# Altium project Rackmonitor.PrjPcb (part 1 of 2)
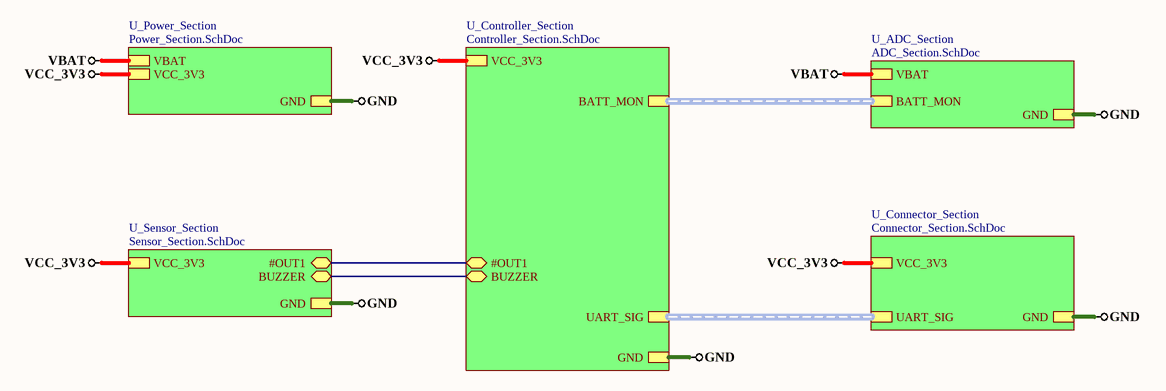
[diagram p0: Top_Section.SchDoc]
6 sheets, 59 parts. Net scope: strictly hierarchical (ports join the sheet entries above them; power ports are local).
Board file: Shock_Sensor.PcbDoc
Sheets:
  Top_Section.SchDoc
    U_Sensor_Section = Sensor_Section.SchDoc
    U_ADC_Section = ADC_Section.SchDoc
    U_Power_Section = Power_Section.SchDoc
    U_Controller_Section = Controller_Section.SchDoc
    U_Connector_Section = Connector_Section.SchDoc

## Sheet Top_Section.SchDoc
size A; DocumentNumber: 6; SheetNumber: 1; SheetTotal: 6

### Sub-sheets
U_ADC_Section = ADC_Section.SchDoc: GND, VBAT, BATT_MON (harness BATT_MON)
U_Connector_Section = Connector_Section.SchDoc: GND, UART_SIG (harness UART_SIG), VCC_3V3
U_Controller_Section = Controller_Section.SchDoc: GND, VCC_3V3, #OUT1 (bidir), BATT_MON (harness BATT_MON), UART_SIG (harness UART_SIG), BUZZER (bidir)
U_Power_Section = Power_Section.SchDoc: GND, VBAT, VCC_3V3
U_Sensor_Section = Sensor_Section.SchDoc: GND, VCC_3V3, #OUT1 (bidir), BUZZER (bidir)

### Nets
GND: sheet U_Sensor_Section/GND, sheet U_ADC_Section/GND, sheet U_Power_Section/GND, sheet U_Controller_Section/GND, sheet U_Connector_Section/GND
VBAT: sheet U_ADC_Section/VBAT, sheet U_Power_Section/VBAT
VCC_3V3: sheet U_Sensor_Section/VCC_3V3, sheet U_Power_Section/VCC_3V3, sheet U_Controller_Section/VCC_3V3, sheet U_Connector_Section/VCC_3V3
#OUT1: sheet U_Sensor_Section/#OUT1, sheet U_Controller_Section/#OUT1
BUZZER: sheet U_Sensor_Section/BUZZER, sheet U_Controller_Section/BUZZER

### Buses and harness runs
harness sheet U_ADC_Section/BATT_MON = sheet U_Controller_Section/BATT_MON
harness sheet U_Connector_Section/UART_SIG = sheet U_Controller_Section/UART_SIG

## Sheet Sensor_Section.SchDoc
size A; DocumentNumber: 3; SheetNumber: 4; SheetTotal: 6
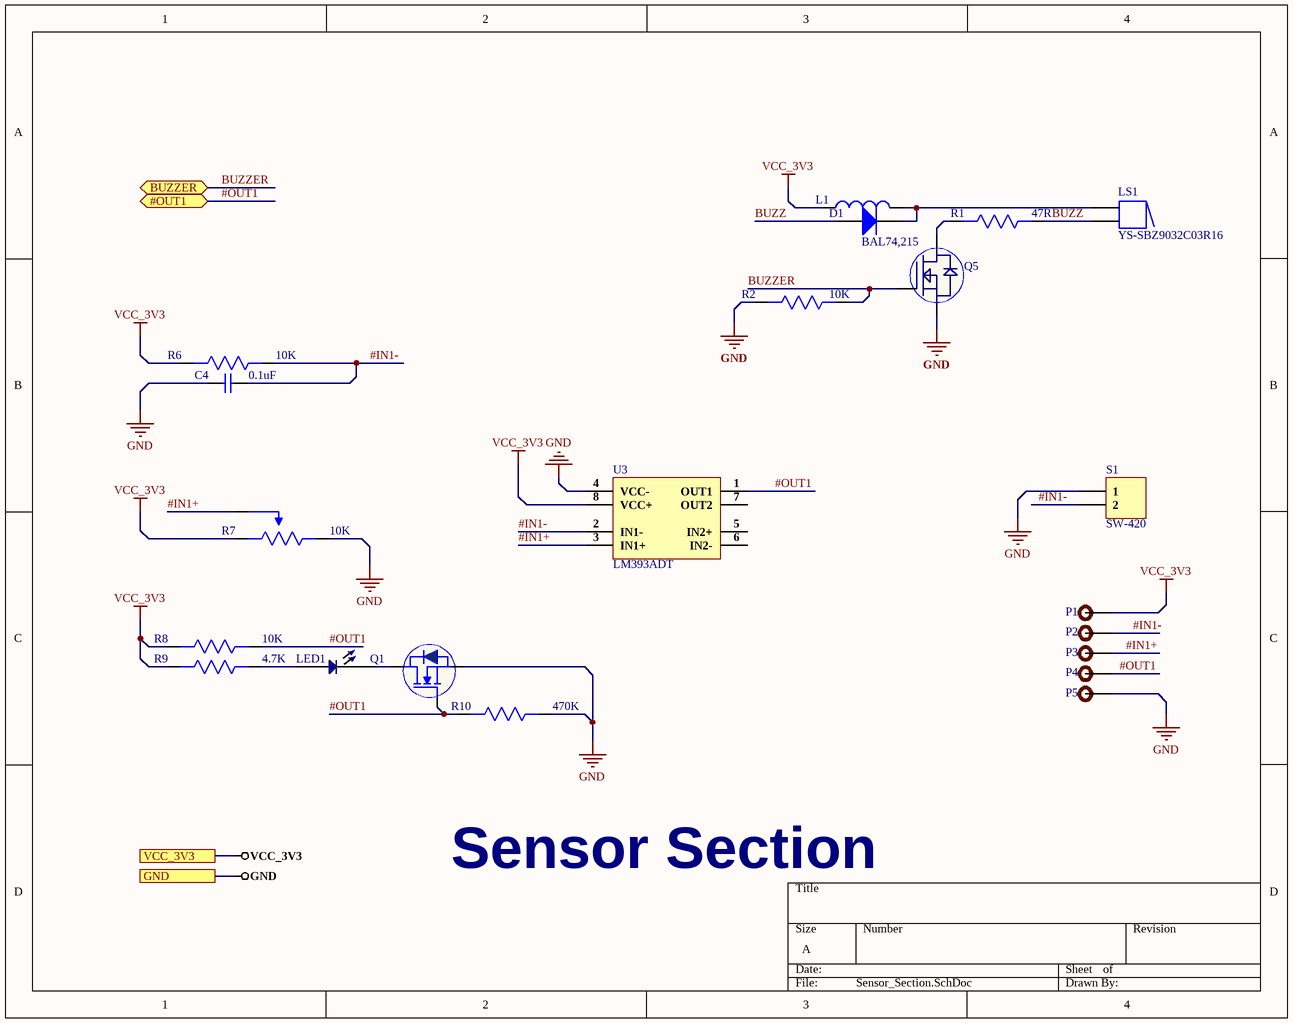
[diagram p1: Sensor_Section.SchDoc]

### Parts
C4  0.1uF  [CAP-0603]
D1  BAL74,215  [sot-23]
L1  MMZ0603S601CT000  [IND 0201]  (value not drawn)
LED1  XZVG68W-2  [LED 0402]  (value not drawn)
LS1  YS-SBZ9032C03R16  [YS-SBZ9032C03R16]
P1  TEST POINT  [TEST POINT]  (value not drawn)
P2  TEST POINT  [TEST POINT]  (value not drawn)
P3  TEST POINT  [TEST POINT]  (value not drawn)
P4  TEST POINT  [TEST POINT]  (value not drawn)
P5  TEST POINT  [TEST POINT]  (value not drawn)
Q1  2N7002T-7-F  [SOT-523]  (value not drawn)
Q5  BSS138LT1G  [sot-23]  (value not drawn)
R1  47R  [RES-0603]
R2  10K  [RES-0603]
R6  10K  [RES-0603]
R7  10K  [TC33X-2-103E]
R8  10K  [RES-0603]
R9  4.7K  [RES-0603]
R10  470K  [RES-0603]
S1  SW-420  [SW-420]
U3  LM393ADT  [8-SOIC]

### Ports
#OUT1 (bidir), BUZZER (bidir), GND, VCC_3V3

### Nets
GND: C4.1 P5.1 Q1.2(S) Q5.2(S) R2.2 R7.3(CW) R10.1 S1.1 U3.4(VCC-) ; port GND
VCC_3V3: L1.1 P1.1 R6.2 R7.1(CCW) R8.2 R9.2 U3.8(VCC+) ; port VCC_3V3
#IN1+: P3.1 R7.2(Wiper) U3.3(IN1+)
#IN1-: C4.2 P2.1 R6.1 S1.2 U3.2(IN1-)
#OUT1: P4.1 Q1.1(G) R8.1 R10.2 U3.1(OUT1) ; port #OUT1
BUZZ: D1.2(A) LS1.2 R1.1
BUZZER: Q5.1(G) R2.1 ; port BUZZER
NetD1_1: D1.1(K) L1.2 LS1.1
NetLED1_1: LED1.1 R9.1
NetLED1_2: LED1.2 Q1.3(G)
NetQ5_3: Q5.3(D) R1.2

Not connected (* = marked no-connect by the designer): U3 5(IN2+) 6(IN2-) 7(OUT2)

### Notes on the sheet
- Sensor Section

### Library data of the parts
C4 = CL10B104KB8NNNL: CL10 Series 0603 0.1 uF 50 V ±10% Tolerance X7R Multilayer Ceramic Capacitor; Manufacturer: Samsung; Capacitance: 100nF; Voltage Rating: 50V; Supplier 1: Digi-Key; Manufacturer Part Number: CL10B104KB8NNNL; RoHS: Yes; Category: Ceramic Capacitors; Pricing 1: 1=0.10000, 10=0.03100, 50=0.01660, 100=0.01360, 500=0.00974, 1000=0.00765, 2500=0.00696, 5000=0.00640 (USD); Mount: Surface Mount; Case/Package: 0603; Min Operating Temperature: -55°C; Max Operating Temperature: 125°C; Tolerance: 10%; Dielectric: X7R; Packaging: Tape and Reel; Package Quantity: 15000; Voltage Rating (DC): 50V; Series: CL; Construction: Flat; Length: 1.6mm; Width: 0.031inch; Height: 0.8mm; Thickness: 0.035inch; Depth: 0.8mm; Radiation Hardening: No; RoHS Compliant: Yes; ComponentLink1URL: https://datasheet.ciiva.com/26838/getdatasheetpartid-357523-26838415.pdf?src-supplier=Verical; ComponentLink1Description: https://datasheet.ciiva.com/26838/getdatasheetpartid-357523-26838415.pdf?src-supplier=Verical; ComponentLink2URL: https://datasheet.ciiva.com/25741/cl10b104kb8nnnl-25741341.pdf?src-supplier=Digi-Key; ComponentLink2Description: https://datasheet.ciiva.com/25741/cl10b104kb8nnnl-25741341.pdf?src-supplier=Digi-Key; Supplier Part Number 1: 1276-CL10B104KB8NNNLDKR-ND
D1 = BAL74,215: DIODE GEN PURP 50V 215MA SOT23; Manufacturer: NXP Semiconductors; Manufacturer Part Number: BAL74215; Element Configuration: Single; Forward Current: 150mA; Max Reverse Current: 100nA; Reverse Recovery Time: 4ns; Peak Non-Repetitive Surge Current: 4A; Forward Voltage: 1.25V; Supplier 1: Newark; RoHS: Yes; Category: Rectifier Diodes; Mount: Surface Mount; Case/Package: TO-236-3; Number of Pins: 3; Contact Plating: Tin; Min Operating Temperature: -65°C; Max Operating Temperature: 150°C; Max Repetitive Reverse Voltage (Vrrm): 50V; Packaging: Tape and Reel; Max Surge Current: 4A; Recovery Time: 4ns; Package Quantity: 1; Max Reverse Leakage Current: 100nA; Average Rectified Current: 215mA; Max Forward Surge Current (Ifsm): 4A; Termination: SMD/SMT; Max Reverse Voltage (DC): 50V; Radiation Hardening: No; REACH SVHC: No SVHC; Lead Free: Lead Free; ComponentLink1URL: https://datasheet.ciiva.com/8299/bal74-8299264.pdf?src-supplier=Avnet; ComponentLink1Description: https://datasheet.ciiva.com/8299/bal74-8299264.pdf?src-supplier=Avnet; ComponentLink2URL: https://datasheet.ciiva.com/1179/453930-1179601.pdf?src-supplier=Element14; ComponentLink2Description: https://datasheet.ciiva.com/1179/453930-1179601.pdf?src-supplier=Element14; ComponentLink3URL: https://datasheet.ciiva.com/4434/bal74-109975-4434835.pdf?src-supplier=Mouser; ComponentLink3Description: https://datasheet.ciiva.com/4434/bal74-109975-4434835.pdf?src-supplier=Mouser; ComponentLink4URL: https://datasheet.ciiva.com/25953/bal74-25953738.pdf?src-supplier=Avnet+Europe; ComponentLink4Description: https://datasheet.ciiva.com/25953/bal74-25953738.pdf?src-supplier=Avnet+Europe; ComponentLink5URL: https://datasheet.ciiva.com/912/bal74-912156.pdf?src-supplier=Digi-Key; ComponentLink5Description: https://datasheet.ciiva.com/912/bal74-912156.pdf?src-supplier=Digi-Key; ComponentLink6URL: https://datasheet.ciiva.com/1202/453930-1202220.pdf?src-supplier=Farnell; ComponentLink6Description: https://datasheet.ciiva.com/1202/453930-1202220.pdf?src-supplier=Farnell; ComponentLink7URL: https://datasheet.ciiva.com/912/bal74-912157.pdf?src-supplier=Digi-Key; ComponentLink7Description: https://datasheet.ciiva.com/912/bal74-912157.pdf?src-supplier=Digi-Key; ComponentLink8URL: https://datasheet.ciiva.com/1202/453930-1202221.pdf?src-supplier=Farnell; ComponentLink8Description: https://datasheet.ciiva.com/1202/453930-1202221.pdf?src-supplier=Farnell; ComponentLink9URL: https://datasheet.ciiva.com/912/bal74-912158.pdf?src-supplier=Digi-Key; ComponentLink9Description: https://datasheet.ciiva.com/912/bal74-912158.pdf?src-supplier=Digi-Key; Supplier Part Number 1: 75R4923
L1 = MMZ0603S601CT000: FERRITE BEAD 600 OHM 0201 1LN; Manufacturer: TDK; Impedance: 600R; Tolerance: 25%; DC Resistance (DCR): 1.45R; Max DC Current: 100mA; Supplier 1: Digi-Key; Manufacturer Part Number: MMZ0603S601CT000; RoHS: Yes; Category: Inductors; Stock 1: 1540; Pricing 1: 1=0.12000, 10=0.09900, 25=0.07680, 50=0.06380, 100=0.05500, 250=0.04400, 500=0.03960, 1000=0.03300, 5000=0.03080 (USD); Mount: Surface Mount; Case/Package: 0201; Core Material: Ferrite; Case Code (Metric): 0603; Case Code (Imperial): 0201; Packaging: Cut Tape; Package Quantity: 15000; Current Rating: 100mA; Length: 0.024inch; Width: 0.012inch; Height: 0.013inch; REACH SVHC: No SVHC; Lead Free: Lead Free; RoHS Compliant: Yes; ComponentLink1URL: https://datasheet.ciiva.com/46381/1795294-46381669.pdf?src-supplier=Element14; ComponentLink1Description: https://datasheet.ciiva.com/46381/1795294-46381669.pdf?src-supplier=Element14; ComponentLink2URL: https://datasheet.ciiva.com/46634/beads-commercial-signal-mmz-en-46634390.pdf?src-supplier=Digi-Key; ComponentLink2Description: https://datasheet.ciiva.com/46634/beads-commercial-signal-mmz-en-46634390.pdf?src-supplier=Digi-Key; ComponentLink3URL: https://datasheet.ciiva.com/48682/beads-commercial-signal-mmz-en-48682603.pdf?src-supplier=Avnet; ComponentLink3Description: https://datasheet.ciiva.com/48682/beads-commercial-signal-mmz-en-48682603.pdf?src-supplier=Avnet; ComponentLink4URL: https://datasheet.ciiva.com/46634/beads-commercial-signal-mmz-en-46634381.pdf?src-supplier=Digi-Key; ComponentLink4Description: https://datasheet.ciiva.com/46634/beads-commercial-signal-mmz-en-46634381.pdf?src-supplier=Digi-Key; Supplier Part Number 1: 445-2146-1-ND
LED1 = XZVG68W-2: LED GREEN CLEAR CHIP SMD; Manufacturer: SunLED; Lens Color: Colorless; Luminous Intensity: 49mcd; Test Current: 20mA; Viewing Angle: 120°; Dominant Wavelength: 570nm; Forward Voltage: 2.1V; Supplier 1: Digi-Key; Manufacturer Part Number: XZVG68W-2; RoHS: Yes; Category: LEDs; Stock 1: 596167; Pricing 1: 1=0.37000, 10=0.29300, 100=0.13140, 500=0.11872, 1000=0.09752 (USD); Mount: Surface Mount; Case/Package: 0402; Color: Green; Case Code (Metric): 1005; Case Code (Imperial): 0402; Packaging: Tape and Reel; Lens Transparency: Clear; Length: 1mm; Width: 0.5mm; Height: 0.6mm; RoHS Compliant: Yes; ComponentLink1URL: http://www.sunledusa.com/products/spec/XZVG68W-2.pdf?src-supplier=Digi-Key; ComponentLink1Description: http://www.sunledusa.com/products/spec/XZVG68W-2.pdf?src-supplier=Digi-Key; ComponentLink2URL: https://www.sunledusa.com/products/spec/XZVG68W-2.pdf?src-supplier=Digi-Key; ComponentLink2Description: https://www.sunledusa.com/products/spec/XZVG68W-2.pdf?src-supplier=Digi-Key; Supplier Part Number 1: 1497-1219-1-ND
LS1 = YS-SBZ9032C03R16: NO 2700Hz 85dB @ 3V, 10cm 3V Φ9mm SMD,9x3.2mm Buzzers RoHS; Manufacturer: Fengming; Operating Voltage: 2 ~ 4V; Package: SMD,9x3.2mm; Frequency - Self Resonant: 2700Hz; Rated Voltage: 3V
P1-P5 = TEST POINT: Test Point ON
Q1 = 2N7002T-7-F: MOSFET N-Channel 60V 0.115A SOT523; Manufacturer: Diodes; Number of Terminals/Pins: 3; Package Body Material: Plastic; Transistor Element Material: SILICON; Continuous Drain Current (ID): 115mA; Gate to Source Voltage (Vgs): 20V; Turn-Off Delay Time: 11ns; Turn-On Delay Time: 7ns; Rds On Max: 7.5R; Input Capacitance: 50pF; Nominal Vgs: 2V; Number of Elements: 1; Max Power Dissipation: 150mW; Drain to Source Resistance: 4.4R; Element Configuration: Single; Time @ Peak Reflow Temperature-Max (s): 10s; Transistor Application: SWITCHING; FET Technology: METAL-OXIDE SEMICONDUCTOR; Supplier 1: Digi-Key; Manufacturer Part Number: 2N7002T-7-F; RoHS: Yes; Category: MOSFETs; Stock 1: 56526; Pricing 1: 1=0.44000, 10=0.32400, 100=0.18340, 500=0.12144, 1000=0.09310 (USD); Mount: Surface Mount; Case/Package: SOT-523; Number of Pins: 3; Weight: 7.1E-05oz; Contact Plating: Tin,Matte; Package Shape: Rectangular; Terminal Finish: Tin; Min Operating Temperature: -55°C; Max Operating Temperature: 150°C; Packaging: Tape and Reel; Package Quantity: 3000; Number of Channels: 1; Drain to Source Voltage (Vdss): 60V; Power Dissipation: 150mW; Threshold Voltage: 2V; Min Breakdown Voltage: 60V; On-State Resistance: 7.5R; Voltage Rating (DC): 60V; Drain to Source Breakdown Voltage: 60V; Current Rating: 115mA; Polarity: N-CHANNEL; Series: -; Drain-source On Resistance-Max: 7.5R; Surface Mount: Yes; Terminal Form: Gull Wing; Terminal Position: DUAL; Moisture Sensitivity Level: 1; Peak Reflow Temperature (Cel): 260°C; JESD-30 Code: R-PDSO-G3; Length: 1.6mm; Width: 0.8mm; Height: 0.75mm; Radiation Hardening: No; REACH SVHC: No SVHC; Lead Free: Lead Free; RoHS Compliant: Yes; ComponentLink1URL: https://datasheet.ciiva.com/17103/2n7002t-7-f-17103286.pdf?src-supplier=Allied+Electronics; ComponentLink1Description: https://datasheet.ciiva.com/17103/2n7002t-7-f-17103286.pdf?src-supplier=Allied+Electronics; ComponentLink2URL: https://datasheet.ciiva.com/3304/ds30301-3304394.pdf?src-supplier=Avnet; ComponentLink2Description: https://datasheet.ciiva.com/3304/ds30301-3304394.pdf?src-supplier=Avnet; ComponentLink3URL: https://datasheet.ciiva.com/34302/1538460-34302350.pdf?src-supplier=Jameco; ComponentLink3Description: https://datasheet.ciiva.com/34302/1538460-34302350.pdf?src-supplier=Jameco; ComponentLink4URL: https://datasheet.ciiva.com/934/ds30301-934599.pdf?src-supplier=Digi-Key; ComponentLink4Description: https://datasheet.ciiva.com/934/ds30301-934599.pdf?src-supplier=Digi-Key; ComponentLink5URL: https://datasheet.ciiva.com/15219/getdatasheetpartid-141065-15219671.pdf?src-supplier=Verical; ComponentLink5Description: https://datasheet.ciiva.com/15219/getdatasheetpartid-141065-15219671.pdf?src-supplier=Verical; ComponentLink6URL: https://datasheet.ciiva.com/934/ds30301-934600.pdf?src-supplier=Digi-Key; ComponentLink6Description: https://datasheet.ciiva.com/934/ds30301-934600.pdf?src-supplier=Digi-Key; ComponentLink7URL: https://datasheet.ciiva.com/934/ds30301-934601.pdf?src-supplier=Digi-Key; ComponentLink7Description: https://datasheet.ciiva.com/934/ds30301-934601.pdf?src-supplier=Digi-Key; ComponentLink8URL: https://datasheet.ciiva.com/22712/1915455-22712378.pdf?src-supplier=Element14; ComponentLink8Description: https://datasheet.ciiva.com/22712/1915455-22712378.pdf?src-supplier=Element14; ComponentLink9URL: https://datasheet.ciiva.com/3304/ds30301-3304395.pdf?src-supplier=Avnet; ComponentLink9Description: https://datasheet.ciiva.com/3304/ds30301-3304395.pdf?src-supplier=Avnet; ComponentLink10URL: https://datasheet.ciiva.com/16287/ds30301-16287372.pdf?src-supplier=Future+Electronics; ComponentLink10Description: https://datasheet.ciiva.com/16287/ds30301-16287372.pdf?src-supplier=Future+Electronics; ComponentLink11URL: https://datasheet.ciiva.com/1188/ds30301-1188477.pdf?src-supplier=Element14; ComponentLink11Description: https://datasheet.ciiva.com/1188/ds30301-1188477.pdf?src-supplier=Element14; ComponentLink12URL: https://datasheet.ciiva.com/17323/ds30301-17323949.pdf?src-supplier=Avnet+Europe; ComponentLink12Description: https://datasheet.ciiva.com/17323/ds30301-17323949.pdf?src-supplier=Avnet+Europe; Supplier Part Number 1: 2N7002T-FDICT-ND
Q5 = BSS138LT1G: MOSFET N-CH 50V 200MA SOT-23; Manufacturer: ON Semiconductor; Gate to Source Voltage (Vgs): 20V; Nominal Vgs: 1.5V; Rds On Max: 3.5R; Input Capacitance: 50pF; Number of Elements: 1; Max Power Dissipation: 225mW; Turn-Off Delay Time: 20ns; Element Configuration: Single; ComponentLink1URL: https://datasheet.ciiva.com/22641/1596366-22641636.pdf; ComponentLink1Description: https://datasheet.ciiva.com/22641/1596366-22641636.pdf; ComponentLink2URL: https://datasheet.ciiva.com/1190/1596366-1190137.pdf; ComponentLink2Description: https://datasheet.ciiva.com/1190/1596366-1190137.pdf; ComponentLink3URL: https://datasheet.ciiva.com/15198/getdatasheetpartid-110266-15198908.pdf; ComponentLink3Description: https://datasheet.ciiva.com/15198/getdatasheetpartid-110266-15198908.pdf; ComponentLink4URL: https://datasheet.ciiva.com/8115/bss138lt1-d-8115295.pdf; ComponentLink4Description: https://datasheet.ciiva.com/8115/bss138lt1-d-8115295.pdf; ComponentLink5URL: https://datasheet.ciiva.com/8115/bss138lt1-d-8115358.pdf; ComponentLink5Description: https://datasheet.ciiva.com/8115/bss138lt1-d-8115358.pdf; ComponentLink6URL: https://datasheet.ciiva.com/1190/1596366-1190136.pdf; ComponentLink6Description: https://datasheet.ciiva.com/1190/1596366-1190136.pdf; ComponentLink7URL: https://datasheet.ciiva.com/936/bss138lt1-d-936802.pdf; ComponentLink7Description: https://datasheet.ciiva.com/936/bss138lt1-d-936802.pdf; ComponentLink8URL: https://datasheet.ciiva.com/936/bss138lt1-d-936801.pdf; ComponentLink8Description: https://datasheet.ciiva.com/936/bss138lt1-d-936801.pdf; ComponentLink9URL: https://datasheet.ciiva.com/14553/70099493-14553829.pdf; ComponentLink9Description: https://datasheet.ciiva.com/14553/70099493-14553829.pdf; ComponentLink10URL: https://datasheet.ciiva.com/936/bss138lt1-d-936803.pdf; ComponentLink10Description: https://datasheet.ciiva.com/936/bss138lt1-d-936803.pdf; Supplier 1: Digi-Key; Manufacturer Part Number: BSS138LT1G; Stock 1: 1283212; Pricing 1: 1=0.27, 10=0.222, 100=0.1177, 500=0.07746, 1000=0.05267 (USD); Case/Package: SOT-23-3; Number of Pins: 3; Contact Plating: Tin,Matte; Min Operating Temperature: -55°C; Max Operating Temperature: 150°C; Continuous Drain Current (ID): 200mA; Package Quantity: 1; Packaging: Tape and Reel; Drain to Source Breakdown Voltage: 50V; Power Dissipation: 225mW; Drain to Source Resistance: 3.5R; Threshold Voltage: 1.5V; Turn-On Delay Time: 20ns; Voltage Rating (DC): 50V; Current Rating: 200mA; On-State Resistance: 3.5R; Length: 3.04mm; Height: 1.01mm; Width: 1.4mm; Radiation Hardening: No; REACH SVHC: No SVHC; Lead Free: Lead Free; Halogen Free: Halogen Free; ComponentLink11URL: http://www.onsemi.com/pub/Collateral/BSS138LT1-D.PDF?src-supplier=Digi-Key; ComponentLink11Description: http://www.onsemi.com/pub/Collateral/BSS138LT1-D.PDF?src-supplier=Digi-Key; ComponentLink12URL: http://www.farnell.com/datasheets/1596366.pdf?src-supplier=Element14; ComponentLink12Description: http://www.farnell.com/datasheets/1596366.pdf?src-supplier=Element14; ComponentLink13URL: http://www.alliedelec.com/m/d/b3c6fd7d92596813fe75d33dcbaaae90.pdf?src-supplier=Allied+Electronics; ComponentLink13Description: http://www.alliedelec.com/m/d/b3c6fd7d92596813fe75d33dcbaaae90.pdf?src-supplier=Allied+Electronics; ComponentLink14URL: https://www.verical.com/server-webapp/html/getDatasheet?partID=110266&src-supplier=Verical; ComponentLink14Description: https://www.verical.com/server-webapp/html/getDatasheet?partID=110266&src-supplier=Verical; ComponentLink15URL: http://www.onsemi.com/pub_link/Collateral/BSS138LT1-D.PDF?src-supplier=Avnet; ComponentLink15Description: http://www.onsemi.com/pub_link/Collateral/BSS138LT1-D.PDF?src-supplier=Avnet; Supplier Part Number 1: BSS138LT1GOSDKR-ND
R1 = RT0603BRD0747RL: RES SMD 47 OHM 0.1% 1/10W 0603; Manufacturer: Yageo; Voltage Rating: 75V; Power Rating: 100mW; Temperature Coefficient: 25ppm/°C; Voltage Rating (DC): 50V; Supplier 1: Digi-Key; Manufacturer Part Number: RT0603BRD0747RL; RoHS: Yes; Category: Chip SMD Resistors; Stock 1: 10926; Pricing 1: 1=0.34000, 10=0.28800, 100=0.11260, 1000=0.04716, 2500=0.04322 (USD); Case/Package: 0603; Case Code (Metric): 1608; Case Code (Imperial): 0603; Contact Plating: Tin,Lead; Min Operating Temperature: -55°C; Max Operating Temperature: 125°C; Resistance: 47R; Tolerance: 0.1%; Packaging: Tape and Reel; Package Quantity: 5000; Resistor Type: Thin Film; Termination: SMD/SMT; Number of Terminations: 2; Max Power Dissipation: 100mW; Features: Moisture Resistant; Series: RT; Construction: Rectangular; Length: 0.063inch; Width: 0.031inch; Height: 0.022inch; Depth: 0.8mm; Military Standard: Not; Lead Free: Lead Free; RoHS Compliant: Yes; ComponentLink1URL: https://datasheet.ciiva.com/2585/pyu-rt-1-to-0-05-rohs-l-4-2585966.pdf?src-supplier=Digi-Key; ComponentLink1Description: https://datasheet.ciiva.com/2585/pyu-rt-1-to-0-05-rohs-l-4-2585966.pdf?src-supplier=Digi-Key; ComponentLink2URL: https://datasheet.ciiva.com/46635/pyu-rt-1-to-0-05-rohs-l-5-46635308.pdf?src-supplier=Digi-Key; ComponentLink2Description: https://datasheet.ciiva.com/46635/pyu-rt-1-to-0-05-rohs-l-5-46635308.pdf?src-supplier=Digi-Key; Supplier Part Number 1: YAG1668CT-ND
R2 R6 R8 = CRGH0603J10K: Surface Mount Thick Film Resistor, CRG Series, 10 kohm, 200 mW, - 5%, 50 V, 0603 [1608 Metric] ;RoHS Compliant: Yes; Manufacturer: TE Connectivity Holsworthy; Resistance: 10kR; Temperature Coefficient: 100ppm/°C; Power Rating: 200mW; Voltage Rating: 50V; Number of Resistors: 1; Supplier 1: Digi-Key; Manufacturer Part Number: CRGH0603J10K; RoHS: Yes; Category: Chip SMD Resistors; Stock 1: 5000; Pricing 1: 5000=0.00758 (USD); Mount: Surface Mount; Case/Package: 0603; Case Code (Imperial): 0603; Case Code (Metric): 1608; Min Operating Temperature: -55°C; Max Operating Temperature: 125°C; Tolerance: 5%; Packaging: Tape and Reel; Resistor Type: Thick Film,Power resistor; Number of Terminations: 2; Series: CRGH; Termination: Solder; Voltage Rating (DC): 50V; Resistance Tolerance: 5%; Technology: THICK FILM; Length: 1.6mm; Width: 0.8mm; Height: 0.45mm; Depth: 0.8mm; RoHS Compliant: Yes; REACH SVHC: No SVHC; ELV: Compliant; ComponentLink1URL: https://datasheet.ciiva.com/22722/1755795-22722956.pdf?src-supplier=Element14; ComponentLink1Description: https://datasheet.ciiva.com/22722/1755795-22722956.pdf?src-supplier=Element14; Supplier Part Number 1: A126394TR-ND
R7 = TC33X-2-103E: TRIMMER 10K OHM 0.1W J LEAD TOP; Manufacturer: Bourns; Tolerance: 25%; Resistance: 10kR; Number of Turns: 1; Power Rating: 100mW; Temperature Coefficient: 250ppm/°C; Voltage Rating (DC): 50V; Supplier 1: Digi-Key; Manufacturer Part Number: TC33X-2-103E; Stock 1: 79201; Pricing 1: 1=0.26, 10=0.252, 25=0.2276, 50=0.217, 100=0.21, 250=0.196, 500=0.1785, 1000=0.161 (USD); Mount: Surface Mount; Color: Silver; Weight: 29.4mg; Contact Plating: Copper,Tin,Silver; Min Operating Temperature: -40°C; Max Operating Temperature: 100°C; Packaging: Tape and Reel; Package Quantity: 2500; Resistor Type: Cermet; Termination: Foot Print; Taper: Linear; Max Power Dissipation: 100mW; Series: TC33; Resistance Tolerance: 25%; Length: 3mm; Width: 0.118inch; Height: 0.047inch; Depth: 3.8mm; Radiation Hardening: No; REACH SVHC: No SVHC; Military Standard: Not; Lead Free: Lead Free; RoHS Compliant: Yes; ComponentLink1URL: http://www.farnell.com/datasheets/2146212.pdf?src-supplier=Element14; ComponentLink1Description: http://www.farnell.com/datasheets/2146212.pdf?src-supplier=Element14; ComponentLink2URL: http://www.farnell.com/datasheets/1520225.pdf?src-supplier=Element14; ComponentLink2Description: http://www.farnell.com/datasheets/1520225.pdf?src-supplier=Element14; ComponentLink3URL: http://uk.rs-online.com/webdocs/0274/0900766b802749b3.pdf?src-supplier=RSComponents; ComponentLink3Description: http://uk.rs-online.com/webdocs/0274/0900766b802749b3.pdf?src-supplier=RSComponents; ComponentLink4URL: https://www.bourns.com/docs/Product-Datasheets/TC33.pdf?src-supplier=Digi-Key; ComponentLink4Description: https://www.bourns.com/docs/Product-Datasheets/TC33.pdf?src-supplier=Digi-Key; ComponentLink5URL: http://www.bourns.com/pdfs/tc33.pdf?src-supplier=Avnet; ComponentLink5Description: http://www.bourns.com/pdfs/tc33.pdf?src-supplier=Avnet; ComponentLink6URL: https://www.verical.com/server-webapp/html/getDatasheet?partID=183773&src-supplier=Verical; ComponentLink6Description: https://www.verical.com/server-webapp/html/getDatasheet?partID=183773&src-supplier=Verical; ComponentLink7URL: http://www.bourns.com/pdfs/tc33.pdf?src-supplier=Avnet+Europe; ComponentLink7Description: http://www.bourns.com/pdfs/tc33.pdf?src-supplier=Avnet+Europe; Supplier Part Number 1: TC33X-103EDKR-ND
R9 = RC0603FR-074K7L: RES SMD 4.7K OHM 1% 1/10W 0603; Manufacturer: Yageo; Resistance: 4.7kR; Temperature Coefficient: 100ppm/°C; Power Rating: 100mW; Voltage Rating (DC): 50V; Supplier 1: Digi-Key; Manufacturer Part Number: RC0603FR-074K7L; RoHS: Yes; Category: Chip SMD Resistors; Stock 1: 1924316; Pricing 1: 1=0.10000, 10=0.02400, 100=0.00970, 1000=0.00436, 2500=0.00378 (USD); Case/Package: 0603; Number of Pins: 2; Case Code (Imperial): 0603; Case Code (Metric): 1608; Size Code: 0603; Min Operating Temperature: -55°C; Max Operating Temperature: 155°C; Tolerance: 1%; Resistor Type: Thick Film; Packaging: Tape and Reel; Voltage Rating: 50V; Termination: SMD/SMT; Features: Moisture Resistant; Series: RC; Max Power Dissipation: 100mW; Number of Terminations: 2; Construction: Rectangular; Resistance Tolerance: 1%; Length: 1.6mm; Width: 0.8mm; Height: 0.45mm; Depth: 0.8mm; Lead Pitch: 0.3mm; REACH SVHC: No SVHC; Lead Free: Lead Free; RoHS Compliant: Yes; Military Standard: Not; ComponentLink1URL: https://datasheet.ciiva.com/15189/getdatasheetpartid-422754-15189760.pdf?src-supplier=Verical; ComponentLink1Description: https://datasheet.ciiva.com/15189/getdatasheetpartid-422754-15189760.pdf?src-supplier=Verical; ComponentLink2URL: https://datasheet.ciiva.com/22747/443971-22747528.pdf?src-supplier=Element14; ComponentLink2Description: https://datasheet.ciiva.com/22747/443971-22747528.pdf?src-supplier=Element14; ComponentLink3URL: https://datasheet.ciiva.com/7660/38590-7660794.pdf?src-supplier=Element14; ComponentLink3Description: https://datasheet.ciiva.com/7660/38590-7660794.pdf?src-supplier=Element14; ComponentLink4URL: https://datasheet.ciiva.com/7746/1868787-7746365.pdf?src-supplier=Element14; ComponentLink4Description: https://datasheet.ciiva.com/7746/1868787-7746365.pdf?src-supplier=Element14; ComponentLink5URL: https://datasheet.ciiva.com/46440/1868787-46440909.pdf?src-supplier=Element14; ComponentLink5Description: https://datasheet.ciiva.com/46440/1868787-46440909.pdf?src-supplier=Element14; ComponentLink6URL: https://datasheet.ciiva.com/7746/1738695-7746366.pdf?src-supplier=Element14; ComponentLink6Description: https://datasheet.ciiva.com/7746/1738695-7746366.pdf?src-supplier=Element14; Supplier Part Number 1: 311-4.70KHRCT-ND
R10 = RC0603FR-13470KL: Thick Film Resistors - SMD 470K OHM 1%; Manufacturer: Yageo; Resistance: 470kR; Temperature Coefficient: 100ppm/°C; Power Rating: 100mW; Voltage Rating: 50V; Supplier 1: Digi-Key; Manufacturer Part Number: RC0603FR-13470KL; RoHS: Yes; Category: Chip SMD Resistors; Stock 1: 39775; Pricing 1: 1=0.10000, 10=0.02400, 100=0.00970, 1000=0.00436, 2500=0.00378, 5000=0.00312 (USD); Case/Package: 0603; Contact Plating: Tin,Matte; Case Code (Imperial): 0603; Case Code (Metric): 1608; Min Operating Temperature: -55°C; Max Operating Temperature: 155°C; Tolerance: 1%; Resistor Type: Thick Film; Packaging: Tape and Reel; Termination: SMD/SMT; Series: RC; Construction: Rectangular; Length: 1.6mm; Width: 0.8mm; Height: 0.45mm; Depth: 0.8mm; Military Standard: Not; RoHS Compliant: Yes; ComponentLink1URL: https://datasheet.ciiva.com/8885/pyu-rc0603-51-rohs-l-4-8885646.pdf?src-supplier=Avnet; ComponentLink1Description: https://datasheet.ciiva.com/8885/pyu-rc0603-51-rohs-l-4-8885646.pdf?src-supplier=Avnet; Supplier Part Number 1: 13-RC0603FR-13470KLCT-ND
S1 = SW-420: Vibration sensor; Parameter 2: *; ComponentLink1Description: Aliexpress; ComponentLink1URL: https://tr.aliexpress.com/item/1005003062565290.html?spm=a2g0o.productlist.0.0.6dc62332GmTktf&algo_pvid=31de4c40-91e4-4476-89b4-9a70fcc8c0f5&algo_exp_id=31de4c40-91e4-4476-89b4-9a70fcc8c0f5-1&pdp_ext_f=%7B%7D
U3 = LM393ADT: STMICROELECTRONICS - LM393ADT - Analogue Comparator, Low Power, 2 Comparators, 300 ns, 2V to 36V, ± 1V to ± 18V, SOIC, 8 Pins; Voltage Gain: 106.02dB; Max Power Dissipation: 830mW; Nominal Supply Current: 1mA; Number of Channels: 2; Input Offset Voltage (Vos): 2mV; Input Bias Current: 100nA; Output Current: 18mA; Quiescent Current: 2.5mA; Output Current per Channel: 100pA; Response Time: 1.3us; Natural Thermal Resistance: 125°C/W; Output Type: TTL; Supplier 1: Digi-Key; Manufacturer: STMicroelectronics; Manufacturer Part Number: LM393ADT; RoHS: Yes; Category: Comparators; Stock 1: 2751; Pricing 1: 1=0.43000, 10=0.36800, 25=0.34360, 100=0.27480, 250=0.25520, 500=0.21594, 1000=0.16687 (USD); Mount: Surface Mount; Case/Package: SO; Number of Pins: 8; Min Operating Temperature: 0°C; Max Operating Temperature: 70°C; Max Supply Voltage: 36V; Min Supply Voltage: 2V; Min Dual Supply Voltage: 1V; Max Dual Supply Voltage: 18V; Packaging: Tape and Reel; Package Quantity: 2500; Number of Elements: 2; Max Input Current: 100nA; Max Supply Current: 1mA; Power Dissipation: 830mW; Type: General Purpose; Supply Current: 1mA; Series: LM393; Technology: BIPOLAR; Length: 5mm; Width: 4mm; Height: 1.5mm; Radiation Hardening: No; RoHS Compliant: Yes; Lead Free: Lead Free; ComponentLink1URL: https://datasheet.ciiva.com/15131/getdatasheetpartid-303912-15131180.pdf?src-supplier=Verical; ComponentLink1Description: https://datasheet.ciiva.com/15131/getdatasheetpartid-303912-15131180.pdf?src-supplier=Verical; ComponentLink2URL: https://datasheet.ciiva.com/1827/cd00000465-1827216.pdf?src-supplier=Digi-Key; ComponentLink2Description: https://datasheet.ciiva.com/1827/cd00000465-1827216.pdf?src-supplier=Digi-Key; ComponentLink3URL: https://datasheet.ciiva.com/1827/cd00000465-1827217.pdf?src-supplier=Digi-Key; ComponentLink3Description: https://datasheet.ciiva.com/1827/cd00000465-1827217.pdf?src-supplier=Digi-Key; ComponentLink4URL: https://datasheet.ciiva.com/1827/cd00000465-1827218.pdf?src-supplier=Digi-Key; ComponentLink4Description: https://datasheet.ciiva.com/1827/cd00000465-1827218.pdf?src-supplier=Digi-Key; ComponentLink5URL: https://datasheet.ciiva.com/4463/cd00000465-4463932.pdf?src-supplier=Mouser; ComponentLink5Description: https://datasheet.ciiva.com/4463/cd00000465-4463932.pdf?src-supplier=Mouser; ComponentLink6URL: https://datasheet.ciiva.com/16444/cd00000465-16444173.pdf?src-supplier=Future+Electronics; ComponentLink6Description: https://datasheet.ciiva.com/16444/cd00000465-16444173.pdf?src-supplier=Future+Electronics; Supplier Part Number 1: 497-4267-1-ND

## Sheet ADC_Section.SchDoc
size A; DocumentNumber: 5; SheetNumber: 6; SheetTotal: 6
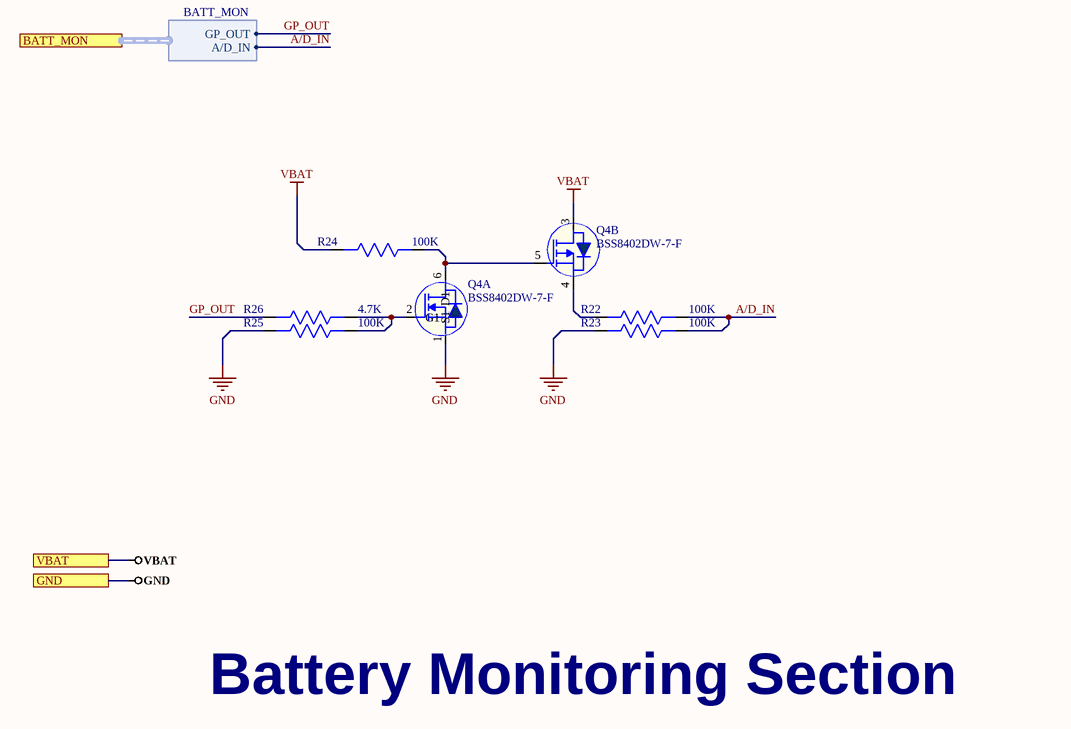
[diagram p2: ADC_Section.SchDoc]

### Parts
Q4  BSS8402DW-7-F  [SOT-363]  (parts A,B of 2)
R22  100K  [RES-0603]
R23  100K  [RES-0603]
R24  100K  [RES-0603]
R25  100K  [RES-0603]
R26  4.7K  [RES-0603]

### Ports
BATT_MON (harness BATT_MON), GND, VBAT

### Harnesses
BATT_MON: GP_OUT, A/D_IN

### Nets
GND: Q4.1(S1) R23.2 R25.2 ; port GND
VBAT: Q4.3(D2) R24.1 ; port VBAT
A/D_IN: R22.1 R23.1 ; port BATT_MON.A/D_IN
GP_OUT: R26.2 ; port BATT_MON.GP_OUT
NetQ4_2: Q4.2(G1) R25.1 R26.1
NetQ4_4: Q4.4(S2) R22.2
NetQ4_5: Q4.5(G2) Q4.6(D1) R24.2

### Notes on the sheet
- Battery Monitoring Section

### Library data of the parts
Q4 = BSS8402DW-7-F: MOSFET N/P-CH 60V/50V SC70-6; Manufacturer: Diodes; Gate to Source Voltage (Vgs): 20V; Nominal Vgs: 2.5V; Rds On Max: 7.5R; Input Capacitance: 50pF; Max Power Dissipation: 200mW; Number of Elements: 2; Dual Supply Voltage: 60V; Continuous Drain Current (ID): 115mA; Drain to Source Resistance: 4.4R; Turn-Off Delay Time: 18ns; Drain to Source Voltage (Vdss): -50V; Element Configuration: Dual; Turn-On Delay Time: 10ns; On-State Resistance: 10R; FET Type: N and P-Channel; Polarity: N-CHANNEL,P-CHANNEL; Supplier 1: Digi-Key; Manufacturer Part Number: BSS8402DW-7-F; RoHS: Yes; Category: MOSFETs; Stock 1: 180980; Pricing 1: 1=0.55000, 10=0.44500, 100=0.30310, 500=0.22730, 1000=0.17048 (USD); Mount: Surface Mount; Case/Package: SOT-363; Number of Pins: 6; Weight: 0.000212oz; Contact Plating: Tin,Matte; Min Operating Temperature: -55°C; Max Operating Temperature: 150°C; Package Quantity: 3000; Packaging: Tape and Reel; Power Dissipation: 200mW; Threshold Voltage: 2.5V; Termination: SMD/SMT; Number of Channels: 2; Current Rating: 115mA; Series: -; Drain-source On Resistance-Max: 10R; Length: 2.2mm; Width: 1.35mm; Height: 1mm; REACH SVHC: No SVHC; Lead Free: Lead Free; RoHS Compliant: Yes; ComponentLink1URL: https://datasheet.ciiva.com/1252/ds30380-1252496.pdf?src-supplier=Newark; ComponentLink1Description: https://datasheet.ciiva.com/1252/ds30380-1252496.pdf?src-supplier=Newark; ComponentLink2URL: https://datasheet.ciiva.com/4442/ds30380-80943-4442992.pdf?src-supplier=Mouser; ComponentLink2Description: https://datasheet.ciiva.com/4442/ds30380-80943-4442992.pdf?src-supplier=Mouser; ComponentLink3URL: https://datasheet.ciiva.com/34302/1539454-34302372.pdf?src-supplier=Jameco; ComponentLink3Description: https://datasheet.ciiva.com/34302/1539454-34302372.pdf?src-supplier=Jameco; ComponentLink4URL: https://datasheet.ciiva.com/26789/bss8402dw-7-f-26789052.pdf?src-supplier=IIIC; ComponentLink4Description: https://datasheet.ciiva.com/26789/bss8402dw-7-f-26789052.pdf?src-supplier=IIIC; ComponentLink5URL: https://datasheet.ciiva.com/17323/ds30380-17323221.pdf?src-supplier=Avnet+Europe; ComponentLink5Description: https://datasheet.ciiva.com/17323/ds30380-17323221.pdf?src-supplier=Avnet+Europe; ComponentLink6URL: https://datasheet.ciiva.com/928/ds30380-928742.pdf?src-supplier=Digi-Key; ComponentLink6Description: https://datasheet.ciiva.com/928/ds30380-928742.pdf?src-supplier=Digi-Key; ComponentLink7URL: https://datasheet.ciiva.com/928/ds30380-928743.pdf?src-supplier=Digi-Key; ComponentLink7Description: https://datasheet.ciiva.com/928/ds30380-928743.pdf?src-supplier=Digi-Key; ComponentLink8URL: https://datasheet.ciiva.com/928/ds30380-928744.pdf?src-supplier=Digi-Key; ComponentLink8Description: https://datasheet.ciiva.com/928/ds30380-928744.pdf?src-supplier=Digi-Key; ComponentLink9URL: https://datasheet.ciiva.com/16419/ds30380-16419384.pdf?src-supplier=Future+Electronics; ComponentLink9Description: https://datasheet.ciiva.com/16419/ds30380-16419384.pdf?src-supplier=Future+Electronics; ComponentLink10URL: https://datasheet.ciiva.com/1190/ds30380-1190250.pdf?src-supplier=Element14; ComponentLink10Description: https://datasheet.ciiva.com/1190/ds30380-1190250.pdf?src-supplier=Element14; Supplier Part Number 1: BSS8402DW-FDICT-ND
R22-R25 = RC0603JR-07100KL: Res Thick Film 0603 100K Ohm 5% 1/10W 100ppm/C Molded SMD SMD Paper T/R; Manufacturer: Yageo; Resistance: 100kR; Temperature Coefficient: 100ppm/°C; Voltage Rating: 50V; Power Rating: 100mW; Supplier 1: Digi-Key; Manufacturer Part Number: RC0603JR-07100KL; RoHS: Yes; Category: Chip SMD Resistors; Stock 1: 1210037; Pricing 1: 1=0.10000, 10=0.02000, 100=0.00800, 1000=0.00360, 2500=0.00312 (USD); Case/Package: 0603; Number of Pins: 2; Contact Plating: Tin,Matte; Case Code (Imperial): 0603; Case Code (Metric): 1608; Size Code: 0603; Min Operating Temperature: -55°C; Max Operating Temperature: 155°C; Tolerance: 5%; Resistor Type: Thick Film; Packaging: Tape and Reel; Voltage Rating (DC): 50V; Termination: SMD/SMT; Features: Moisture Resistant; Series: RC; Max Power Dissipation: 100mW; Number of Terminations: 2; Resistance Tolerance: 5%; Width: 0.8mm; Radiation Hardening: No; REACH SVHC: No SVHC; Lead Free: Lead Free; RoHS Compliant: Yes; ComponentLink1URL: https://datasheet.ciiva.com/7746/443971-7746424.pdf?src-supplier=Element14; ComponentLink1Description: https://datasheet.ciiva.com/7746/443971-7746424.pdf?src-supplier=Element14; ComponentLink2URL: https://datasheet.ciiva.com/7983/443971-7983686.pdf?src-supplier=Element14; ComponentLink2Description: https://datasheet.ciiva.com/7983/443971-7983686.pdf?src-supplier=Element14; ComponentLink3URL: https://datasheet.ciiva.com/7746/443971-7746423.pdf?src-supplier=Element14; ComponentLink3Description: https://datasheet.ciiva.com/7746/443971-7746423.pdf?src-supplier=Element14; ComponentLink4URL: https://datasheet.ciiva.com/8887/pyu-rc0603-51-rohs-l-4-8887903.pdf?src-supplier=Avnet; ComponentLink4Description: https://datasheet.ciiva.com/8887/pyu-rc0603-51-rohs-l-4-8887903.pdf?src-supplier=Avnet; Supplier Part Number 1: 311-100KGRCT-ND
R26 = RC0603FR-074K7L: as R9 on sheet Sensor_Section; Supplier 1: Digi-Key; Manufacturer Part Number: RC0603FR-074K7L; RoHS: Yes; Category: Chip SMD Resistors; Stock 1: 1924316; Pricing 1: 1=0.10000, 10=0.02400, 100=0.00970, 1000=0.00436, 2500=0.00378 (USD); Case/Package: 0603; Number of Pins: 2; Case Code (Imperial): 0603; Case Code (Metric): 1608; Size Code: 0603; Min Operating Temperature: -55°C; Max Operating Temperature: 155°C; Tolerance: 1%; Resistor Type: Thick Film; Packaging: Tape and Reel; Voltage Rating: 50V; Termination: SMD/SMT; Features: Moisture Resistant; Series: RC; Max Power Dissipation: 100mW; Number of Terminations: 2; Construction: Rectangular; Resistance Tolerance: 1%; Length: 1.6mm; Width: 0.8mm; Height: 0.45mm; Depth: 0.8mm; Lead Pitch: 0.3mm; REACH SVHC: No SVHC; Lead Free: Lead Free; RoHS Compliant: Yes; Military Standard: Not; ComponentLink1URL: https://datasheet.ciiva.com/15189/getdatasheetpartid-422754-15189760.pdf?src-supplier=Verical; ComponentLink1Description: https://datasheet.ciiva.com/15189/getdatasheetpartid-422754-15189760.pdf?src-supplier=Verical; ComponentLink2URL: https://datasheet.ciiva.com/22747/443971-22747528.pdf?src-supplier=Element14; ComponentLink2Description: https://datasheet.ciiva.com/22747/443971-22747528.pdf?src-supplier=Element14; ComponentLink3URL: https://datasheet.ciiva.com/7660/38590-7660794.pdf?src-supplier=Element14; ComponentLink3Description: https://datasheet.ciiva.com/7660/38590-7660794.pdf?src-supplier=Element14; ComponentLink4URL: https://datasheet.ciiva.com/7746/1868787-7746365.pdf?src-supplier=Element14; ComponentLink4Description: https://datasheet.ciiva.com/7746/1868787-7746365.pdf?src-supplier=Element14; ComponentLink5URL: https://datasheet.ciiva.com/46440/1868787-46440909.pdf?src-supplier=Element14; ComponentLink5Description: https://datasheet.ciiva.com/46440/1868787-46440909.pdf?src-supplier=Element14; ComponentLink6URL: https://datasheet.ciiva.com/7746/1738695-7746366.pdf?src-supplier=Element14; ComponentLink6Description: https://datasheet.ciiva.com/7746/1738695-7746366.pdf?src-supplier=Element14; Supplier Part Number 1: 311-4.70KHRCT-ND

## Sheet Power_Section.SchDoc
size A; DocumentNumber: 4; SheetNumber: 5; SheetTotal: 6
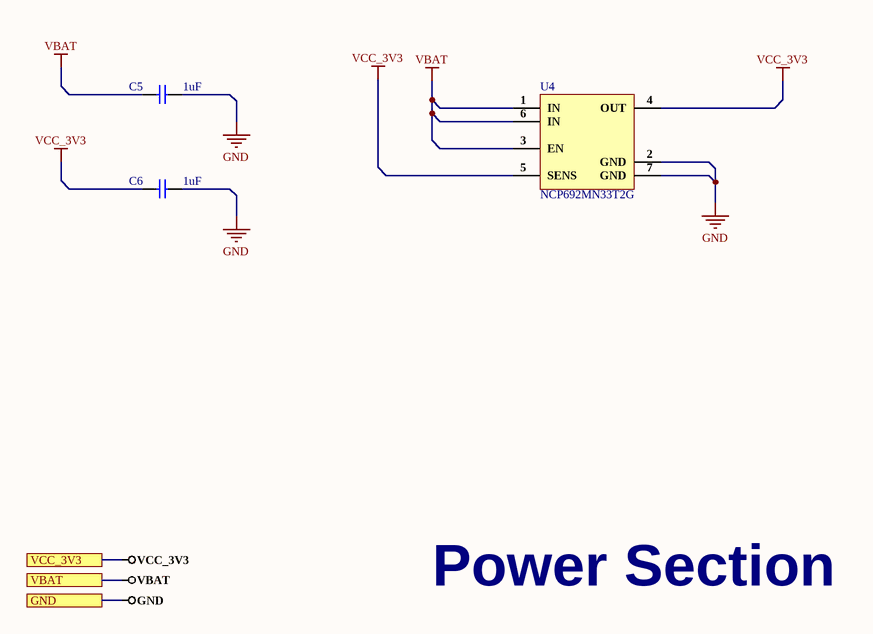
[diagram p3: Power_Section.SchDoc]

### Parts
C5  1uF  [CAP-0603]
C6  1uF  [CAP-0603]
U4  NCP692MN33T2G  [6-DFN (3x3)]

### Ports
GND, VBAT, VCC_3V3

### Nets
GND: C5.2 C6.2 U4.2(GND) U4.7(GND) ; port GND
VBAT: C5.1 U4.1(IN) U4.3(EN) U4.6(IN) ; port VBAT
VCC_3V3: C6.1 U4.4(OUT) U4.5(SENS) ; port VCC_3V3

### Notes on the sheet
- Power Section

### Library data of the parts
C5 C6 = CL10A105KA8NNNC: Ceramic capacitor SMD-0603 1000nF/25V X7R# K +-10%, Samsung, RoHS; Tolerance: 10%; Dielectric: X5R; Voltage: 25V; Supplier 1: Digi-Key; Manufacturer: Samsung; Manufacturer Part Number: CL10A105KA8NNNC; RoHS: Yes; Category: Ceramic Capacitors; Pricing 1: 1=0.10000, 10=0.03500, 50=0.01940, 100=0.01580, 500=0.01128, 1000=0.00886 (USD); Mount: Surface Mount; Case/Package: 0603; Case Code (Metric): 1608; Case Code (Imperial): 0603; Material: Ceramic; Contact Plating: Tin; Min Operating Temperature: -55°C; Max Operating Temperature: 85°C; Capacitance: 1uF; Voltage Rating (DC): 25V; Packaging: Tape and Reel; Package Quantity: 1; Voltage Rating: 25V; Series: CL; Length: 0.063inch; Width: 0.031inch; Height: 0.8mm; Depth: 0.8mm; Thickness: 0.035inch; Radiation Hardening: No; Lead Free: Lead Free; RoHS Compliant: Yes; ComponentLink1URL: https://datasheet.ciiva.com/25801/cl10a105ka8nnnc-25801364.pdf?src-supplier=Digi-Key; ComponentLink1Description: https://datasheet.ciiva.com/25801/cl10a105ka8nnnc-25801364.pdf?src-supplier=Digi-Key; ComponentLink2URL: https://datasheet.ciiva.com/26838/getdatasheetpartid-357530-26838332.pdf?src-supplier=Verical; ComponentLink2Description: https://datasheet.ciiva.com/26838/getdatasheetpartid-357530-26838332.pdf?src-supplier=Verical; ComponentLink3URL: https://datasheet.ciiva.com/29198/458162-da-01-en-vs-kondensator-0603-29198475.pdf?src-supplier=Conrad; ComponentLink3Description: https://datasheet.ciiva.com/29198/458162-da-01-en-vs-kondensator-0603-29198475.pdf?src-supplier=Conrad; Supplier Part Number 1: 1276-1102-6-ND
U4 = NCP692MN33T2G: ON Semiconductor NCP692MN33T2G, LDO Voltage Regulator, 1A, 3.3 V 2%, 1.5  6 Vin, 6-Pin DFN; Output Voltage: 3.3V; Number of Outputs: 1; Min Input Voltage: 1.5V; Max Input Voltage: 6V; Dropout Voltage: 180mV; Min Current Limit: 1.1A; Polarity: Positive; Output Type: Fixed; Supplier 1: Digi-Key; Manufacturer: ON Semiconductor; Manufacturer Part Number: NCP692MN33T2G; RoHS: Yes; Category: Voltage Regulators - Linear; Pricing 1: 1=1.11000, 10=0.98800, 25=0.93800, 100=0.77040, 250=0.72016, 500=0.63642, 1000=0.55300 (USD); Mount: Surface Mount; Case/Package: DFN; Number of Pins: 6; Min Operating Temperature: -40°C; Max Operating Temperature: 85°C; Package Quantity: 3000; Output Current: 1A; Packaging: Tape and Reel; Number of Regulators: 1; Max Output Current: 1A; Output Voltage Accuracy: 2%; Accuracy: 2%; Length: 3mm; Width: 3mm; Height: 0.95mm; Radiation Hardening: No; Lead Free: Lead Free; Halogen Free: Halogen Free; RoHS Compliant: Yes; ComponentLink1URL: https://datasheet.ciiva.com/15271/ncp690-d-15271367.pdf?src-supplier=Arrow+Europe; ComponentLink1Description: https://datasheet.ciiva.com/15271/ncp690-d-15271367.pdf?src-supplier=Arrow+Europe; ComponentLink2URL: https://datasheet.ciiva.com/8231/ncp690-d-8231800.pdf?src-supplier=Avnet; ComponentLink2Description: https://datasheet.ciiva.com/8231/ncp690-d-8231800.pdf?src-supplier=Avnet; ComponentLink3URL: https://datasheet.ciiva.com/2062/ncp690-d-2062340.pdf?src-supplier=Digi-Key; ComponentLink3Description: https://datasheet.ciiva.com/2062/ncp690-d-2062340.pdf?src-supplier=Digi-Key; ComponentLink4URL: https://datasheet.ciiva.com/26179/ncp690-d-26179095.pdf?src-supplier=Avnet+Europe; ComponentLink4Description: https://datasheet.ciiva.com/26179/ncp690-d-26179095.pdf?src-supplier=Avnet+Europe; Supplier Part Number 1: NCP692MN33T2GOSCT-ND